# Altium schematic sheet A3000_PSU.SchDoc
size A3; SheetNumber: 1; SheetTotal: 1
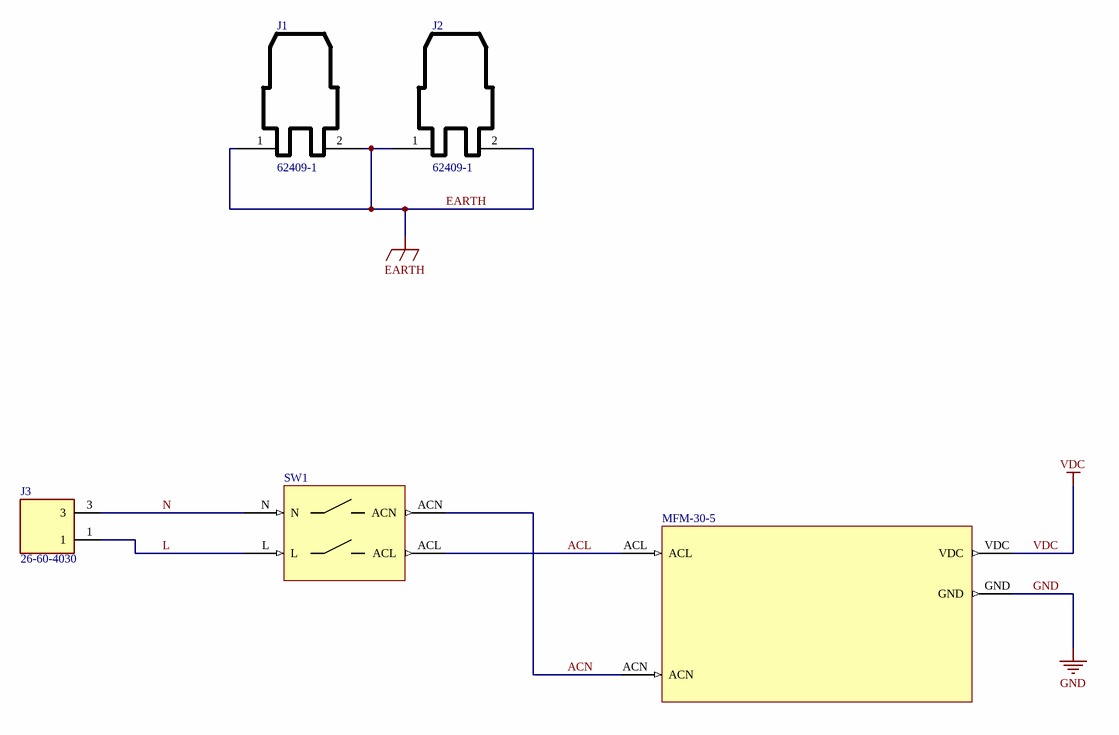
[diagram p0: A3000_PSU.SchDoc]

## Parts
J1  62409-1  [62409-1]
J2  62409-1  [62409-1]
J3  26-60-4030  [SHDR3W155P0X396_1X3_NoMiddle]
MFM-30-5  (no value)  [MFM-30-5]
SW1  DPST_SW  [SWITCH_RS_180-84]  (value not drawn)

## Nets
EARTH: J1.1 J1.2 J2.1 J2.2
GND: MFM-30-5.GND
VDC: MFM-30-5.VDC
ACL: MFM-30-5.ACL SW1.ACL
ACN: MFM-30-5.ACN SW1.ACN
L: J3.1 SW1.L
N: J3.3 SW1.N

## Notes on the sheet
- SIZE
- DIMENSIONS
- TITLE
- VARIANT
- REVISION
- DATE
- A3
- SHEET
- OF
- FILE
- DRAWN BY

## Library data of the parts
J1 J2 = 982-0022: PCB Terminal, 6.35mm x 0.81mm, 0.25" x 0.032", Brass, 1.4 mm, Tin; Manufacturer: TE Coonectivity; Disti Part Number: 892609; Max Current: 24A; Cost(£): 0.807; Part Number: 982-0022; Value: 62409-1; ManuPart: 62409-1; Distributer: Farnell; ComponentLink1Description: Datasheet; ComponentLink1URL: Z:\HW_Common\A2E_Datasheets\TEConnectivity\1861797.pdf; RoHS Compliant: YES; Component Type: Standard
J3 = 26-60-4030_NoMiddle: Connector; Manufacturer_Name: Molex; Datasheet Link: https://componentsearchengine.com/Datasheets/2/26-60-4030.pdf; Height: 15.36mm; Manufacturer_Part_Number: 26-60-4030; Mouser Part Number: 538-26-60-4030; Mouser Price/Stock: https://www.mouser.co.uk/ProductDetail/Molex/26-60-4030?qs=jcz9%252BeLWjlgPf3deDPDuUA%3D%3D
MFM-30-5 = MFM-30-5